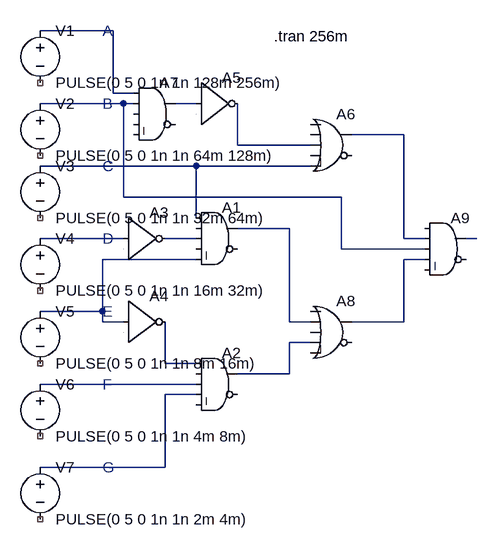
[diagram p0: schematic 11f.asc]
11f.asc, the LTspice schematic file:
Version 4.1
SHEET 1 880 832
WIRE 32 64 -80 64
WIRE 32 160 32 64
WIRE 64 160 32 160
WIRE 48 176 -80 176
WIRE 64 176 48 176
WIRE 160 176 128 176
WIRE 480 224 400 224
WIRE 224 240 224 176
WIRE 336 240 224 240
WIRE 160 272 -80 272
WIRE 336 272 160 272
WIRE 48 320 48 176
WIRE 384 320 48 320
WIRE 160 352 160 272
WIRE 304 368 224 368
WIRE 48 384 -80 384
WIRE 160 384 112 384
WIRE 480 384 480 224
WIRE 512 384 480 384
WIRE 592 384 576 384
WIRE 384 400 384 320
WIRE 512 400 384 400
WIRE 160 416 16 416
WIRE 512 416 480 416
WIRE 16 496 16 416
WIRE 16 496 -80 496
WIRE 16 512 16 496
WIRE 48 512 16 512
WIRE 304 512 304 368
WIRE 336 512 304 512
WIRE 480 512 480 416
WIRE 480 512 400 512
WIRE 336 544 304 544
WIRE 112 576 112 512
WIRE 160 576 112 576
WIRE 304 592 304 544
WIRE 304 592 224 592
WIRE 160 608 -80 608
WIRE 160 624 112 624
WIRE 112 736 112 624
WIRE 112 736 -80 736
SYMBOL voltage -80 48 R0
WINDOW 123 0 0 Left 0
WINDOW 39 0 0 Left 0
SYMATTR InstName V1
SYMATTR Value PULSE(0 5 0 1n 1n 128m 256m)
SYMBOL voltage -80 160 R0
WINDOW 123 0 0 Left 0
WINDOW 39 0 0 Left 0
SYMATTR InstName V2
SYMATTR Value PULSE(0 5 0 1n 1n 64m 128m)
SYMBOL voltage -80 256 R0
WINDOW 123 0 0 Left 0
WINDOW 39 0 0 Left 0
SYMATTR InstName V3
SYMATTR Value PULSE(0 5 0 1n 1n 32m 64m)
SYMBOL voltage -80 368 R0
WINDOW 123 0 0 Left 0
WINDOW 39 0 0 Left 0
SYMATTR InstName V4
SYMATTR Value PULSE(0 5 0 1n 1n 16m 32m)
SYMBOL voltage -80 480 R0
WINDOW 123 0 0 Left 0
WINDOW 39 0 0 Left 0
SYMATTR InstName V5
SYMATTR Value PULSE(0 5 0 1n 1n 8m 16m)
SYMBOL voltage -80 592 R0
WINDOW 123 0 0 Left 0
WINDOW 39 0 0 Left 0
SYMATTR InstName V6
SYMATTR Value PULSE(0 5 0 1n 1n 4m 8m)
SYMBOL voltage -80 720 R0
WINDOW 123 0 0 Left 0
WINDOW 39 0 0 Left 0
SYMATTR InstName V7
SYMATTR Value PULSE(0 5 0 1n 1n 2m 4m)
SYMBOL Digital\\inv 48 320 R0
SYMATTR InstName A3
SYMBOL Digital\\inv 48 448 R0
SYMATTR InstName A4
SYMBOL Digital\\inv 160 112 R0
SYMATTR InstName A5
SYMBOL Digital\\and 96 128 R0
SYMATTR InstName A7
SYMBOL Digital\\or 368 176 R0
SYMATTR InstName A6
SYMBOL Digital\\or 368 464 R0
SYMATTR InstName A8
SYMBOL Digital\\and 544 336 R0
SYMATTR InstName A9
SYMBOL Digital\\and 192 320 R0
SYMATTR InstName A1
SYMBOL Digital\\and 192 544 R0
SYMATTR InstName A2
TEXT 280 72 Left 2 !.tran 256m
TEXT 16 64 Left 2 ;A
TEXT 16 176 Left 2 ;B
TEXT 16 272 Left 2 ;C
TEXT 16 384 Left 2 ;D
TEXT 16 496 Left 2 ;E
TEXT 16 608 Left 2 ;F
TEXT 16 736 Left 2 ;G

The netlist it stands for:
* 11f.asc
V1 N001 NC_01 PULSE(0 5 0 1n 1n 128m 256m)
V2 N002 NC_02 PULSE(0 5 0 1n 1n 64m 128m)
V3 N006 NC_03 PULSE(0 5 0 1n 1n 32m 64m)
V4 N008 NC_04 PULSE(0 5 0 1n 1n 16m 32m)
V5 N011 NC_05 PULSE(0 5 0 1n 1n 8m 16m)
V6 N015 NC_06 PULSE(0 5 0 1n 1n 4m 8m)
V7 N016 NC_07 PULSE(0 5 0 1n 1n 2m 4m)
A3 N008 0 0 0 0 N009 0 0 BUF
A4 N011 0 0 0 0 N014 0 0 BUF
A5 N003 0 0 0 0 N005 0 0 BUF
A7 N001 N002 0 0 0 0 N003 0 AND
A6 0 0 N005 0 N006 0 N004 0 OR
A8 0 N007 0 N013 0 0 N012 0 OR
A9 0 N004 N002 N012 0 0 N010 0 AND
A1 N006 0 N009 0 N011 0 N007 0 AND
A2 N014 0 N015 N016 0 0 N013 0 AND
.tran 256m
* A
* B
* C
* D
* E
* F
* G
.backanno
.end